# Altium project Audio_Meter_V3.2.PrjPcb (part 3 of 6)

## Sheet Battery Charging_Section.SchDoc
size A; DocumentNumber: 4; SheetNumber: 4; SheetTotal: 8
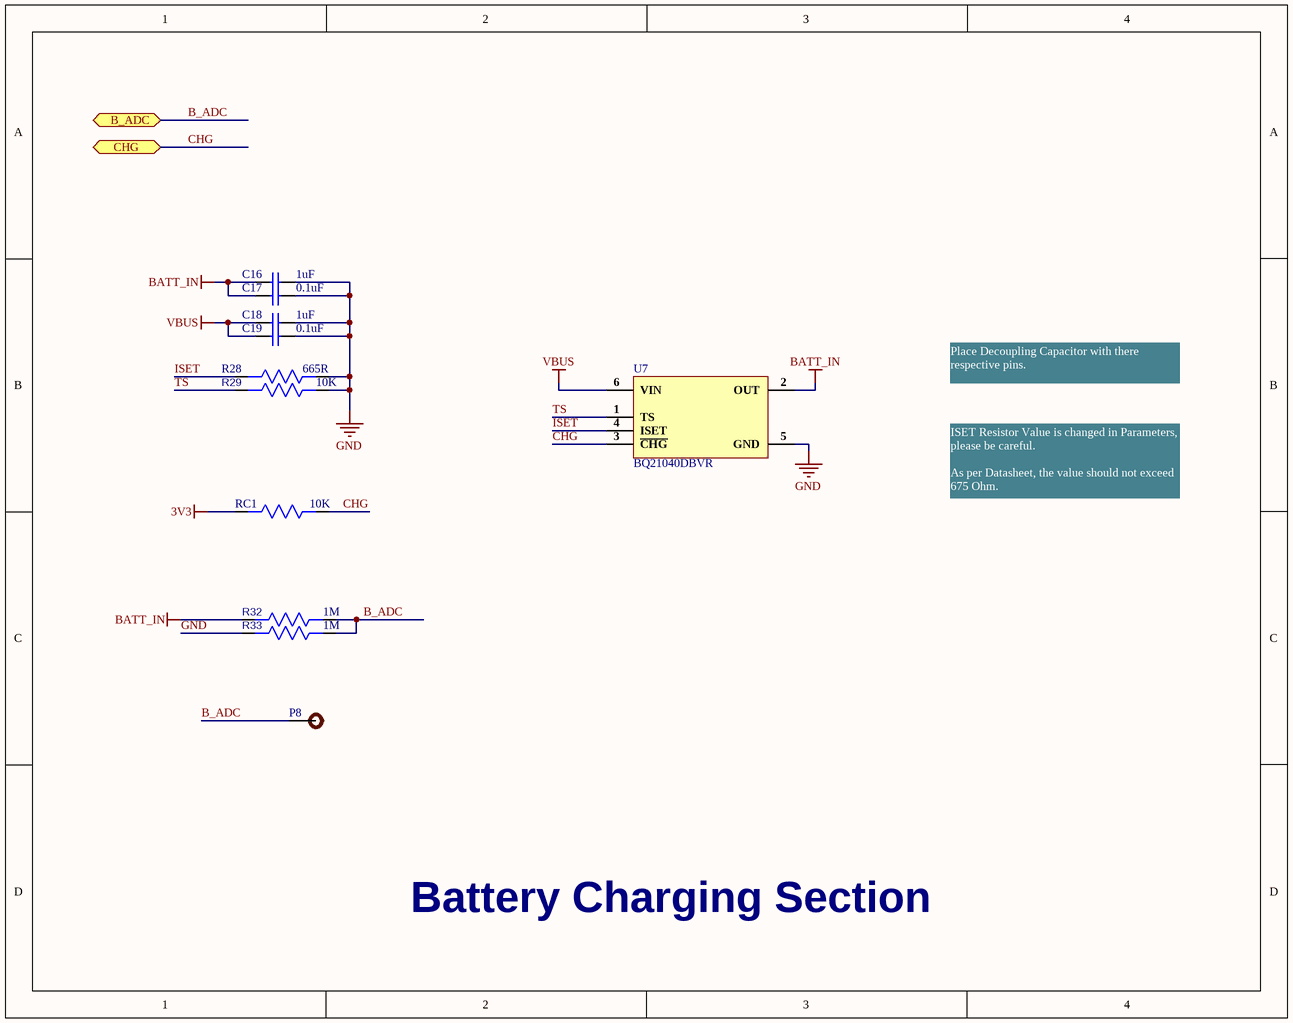
[diagram p4: Battery Charging_Section.SchDoc]

### Parts
C16  1uF  [Cap0805]
C17  0.1uF  [Cap0805]
C18  1uF  [Cap0805]
C19  0.1uF  [Cap0805]
P8  TEST POINT  [TEST POINT]  (value not drawn)
R28  665R  [Res0402]
R29  10K  [RES0805]
R32  1M  [RES0805]
R33  1M  [RES0805]
RC1  10K  [Res0402]
U7  BQ21040DBVR  [SOT-23-6]

### Ports
B_ADC (bidir), CHG (bidir)

### Nets
3V3: RC1.2
BATT_IN: C16.1 C17.1 R32.2 U7.2(OUT)
GND: C16.2 C17.2 C18.2 C19.2 R28.1 R29.1 R33.2 U7.5(GND)
VBUS: C18.1 C19.1 U7.6(VIN)
B_ADC: P8.1 R32.1 R33.1 ; port B_ADC
CHG: RC1.1 U7.3(~{CH}~{G}) ; port CHG
ISET: R28.2 U7.4(ISET)
TS: R29.2 U7.1(TS)

### Notes on the sheet
- Place Decoupling Capacitor with there respective pins.
- ISET Resistor Value is changed in Parameters, please be careful.
  As per Datasheet, the value should not exceed 675 Ohm.
- Battery Charging Section

### Library data of the parts
C16 C18 = CL21B105KOFNNNG: CAP CER 1UF 16V X7R 0805; Manufacturer: Samsung; Material: Ceramic; Tolerance: 10%; Supplier 1: Digi-Key; Manufacturer Part Number: CL21B105KOFNNNG; Stock 1: 507348; Pricing 1: 1=0.1, 10=0.047, 100=0.0211, 500=0.01508, 1000=0.01185 (USD); Mount: Surface Mount; Case/Package: 0805; Case Code (Metric): 2012; Case Code (Imperial): 0805; Min Operating Temperature: -55°C; Max Operating Temperature: 125°C; Package Quantity: 3000; Packaging: Tape and Reel; Capacitance: 1uF; Voltage Rating: 16V; Dielectric: X7R; Voltage: 16V; Length: 2mm; Height: 1.25mm; Width: 0.049inch; Thickness: 0.053inch; Depth: 1.25mm; Lead Free: Lead Free; ComponentLink1URL: http://www.samsungsem.com/global/support/library/product-catalog/__icsFiles/afieldfile/2014/11/13/MLCC.pdf?src-supplier=Digi-Key; ComponentLink1Description: http://www.samsungsem.com/global/support/library/product-catalog/__icsFiles/afieldfile/2014/11/13/MLCC.pdf?src-supplier=Digi-Key; ComponentLink2URL: http://www1.futureelectronics.com/doc/SAMSUNG%20PASSIVE/CL05B104KQ5NNNC.pdf?src-supplier=Future+Electronics; ComponentLink2Description: http://www1.futureelectronics.com/doc/SAMSUNG%20PASSIVE/CL05B104KQ5NNNC.pdf?src-supplier=Future+Electronics; ComponentLink3URL: https://www.distrelec.biz/Web/Downloads/_e/ng/MLCC_CatalogDownload2013_ENG.pdf?mime=application%2Fpdf&src-supplier=Distrelec; ComponentLink3Description: https://www.distrelec.biz/Web/Downloads/_e/ng/MLCC_CatalogDownload2013_ENG.pdf?mime=application%2Fpdf&src-supplier=Distrelec; ComponentLink4URL: https://produktinfo.conrad.com/datenblaetter/450000-474999/455935-da-01-en-VS_KONDENSATOR_0805.pdf?src-supplier=Conrad; ComponentLink4Description: https://produktinfo.conrad.com/datenblaetter/450000-474999/455935-da-01-en-VS_KONDENSATOR_0805.pdf?src-supplier=Conrad; Supplier Part Number 1: 1276-6471-6-ND
C17 C19 = CL21F104ZBCNNNC: CAP CER 0.1UF 50V Y5V 0805; Manufacturer: Samsung; Material: Ceramic; Capacitance: 100nF; Tolerance: 80%; Supplier 1: Digi-Key; Manufacturer Part Number: CL21F104ZBCNNNC; Stock 1: 4901061; Pricing 1: 1=0.1, 10=0.044, 100=0.0195, 500=0.0139, 1000=0.01092 (USD); Mount: Surface Mount; Case/Package: 0805; Case Code (Metric): 2012; Case Code (Imperial): 0805; Min Operating Temperature: -30°C; Max Operating Temperature: 85°C; Dielectric: Y5V; Packaging: Tape and Reel; Voltage Rating: 50V; Package Quantity: 1; Length: 2mm; Height: 0.85mm; Width: 0.049inch; Thickness: 0.037inch; Depth: 1.25mm; Radiation Hardening: No; ComponentLink1URL: https://media.digikey.com/pdf/Data%20Sheets/Samsung%20PDFs/CL_Series_MLCC_ds.pdf?src-supplier=Digi-Key; ComponentLink1Description: https://media.digikey.com/pdf/Data%20Sheets/Samsung%20PDFs/CL_Series_MLCC_ds.pdf?src-supplier=Digi-Key; Supplier Part Number 1: 1276-1007-6-ND
P8 = TEST POINT: Test Point ON
R28 = RC0402FR-07665RL: RES SMD 665 OHM 1% 1/16W 0402; Manufacturer: Yageo; Temperature Coefficient: 100ppm/°C; Power Rating: 62.5mW; Voltage Rating: 50V; Max Power Dissipation: 63mW; Supplier 1: Digi-Key; Manufacturer Part Number: RC0402FR-07665RL; Stock 1: 287830; Pricing 1: 1=0.1, 10=0.015, 100=0.0062, 1000=0.00278, 2500=0.00242, 5000=0.002 (USD); Case/Package: 0402; Contact Plating: Tin,Matte; Case Code (Imperial): 0402; Case Code (Metric): 1005; Min Operating Temperature: -55°C; Max Operating Temperature: 155°C; Resistance: 665R; Tolerance: 1%; Resistor Type: Thick Film; Packaging: Tape and Reel; Number of Terminations: 2; Termination: SMD/SMT; Features: Moisture Resistant; Length: 1mm; Height: 0.016inch; Width: 0.02inch; Depth: 0.5mm; Military Standard: Not; Lead Free: Lead Free; ComponentLink1URL: http://www.yageo.com/documents/recent/PYu-RC0402_51_RoHS_L_6.pdf?src-supplier=Avnet+Europe; ComponentLink1Description: http://www.yageo.com/documents/recent/PYu-RC0402_51_RoHS_L_6.pdf?src-supplier=Avnet+Europe; Supplier Part Number 1: YAG3208CT-ND
R29 = ERJ-P06J103V: RES SMD 10K OHM 5% 1/2W 0805; Manufacturer: Panasonic; Power Rating: 500mW; Voltage Rating: 400V; Temperature Coefficient: 200ppm/°C; Voltage Rating (DC): 150V; ComponentLink1URL: https://www.verical.com/server-webapp/html/getDatasheet?partID=409513; ComponentLink1Description: https://www.verical.com/server-webapp/html/getDatasheet?partID=409513; ComponentLink2URL: http://components.arrow.com/part/dataview/44988207S7163511N1174; ComponentLink2Description: http://components.arrow.com/part/dataview/44988207S7163511N1174; ComponentLink3URL: https://www.seielect.com/Catalog/SEI-RMCF_RMCP.pdf; ComponentLink3Description: https://www.seielect.com/Catalog/SEI-RMCF_RMCP.pdf; ComponentLink4URL: http://www.seielect.com/catalog/sei-rmc.pdf; ComponentLink4Description: http://www.seielect.com/catalog/sei-rmc.pdf; ComponentLink5URL: https://datasheet.ciiva.com/7777/424479-7777391.pdf; ComponentLink5Description: https://datasheet.ciiva.com/7777/424479-7777391.pdf; ComponentLink6URL: https://datasheet.ciiva.com/2581/crcwhpe3-2581488.pdf; ComponentLink6Description: https://datasheet.ciiva.com/2581/crcwhpe3-2581488.pdf; ComponentLink7URL: https://datasheet.ciiva.com/11808/0900766b80d98b26-11808546.pdf; ComponentLink7Description: https://datasheet.ciiva.com/11808/0900766b80d98b26-11808546.pdf; ComponentLink8URL: https://datasheet.ciiva.com/8934/dcrcwe3-8934585.pdf; ComponentLink8Description: https://datasheet.ciiva.com/8934/dcrcwe3-8934585.pdf; ComponentLink9URL: https://datasheet.ciiva.com/2467/dcrcwe3-2467241.pdf; ComponentLink9Description: https://datasheet.ciiva.com/2467/dcrcwe3-2467241.pdf; ComponentLink10URL: https://datasheet.ciiva.com/7777/1697337-7777401.pdf; ComponentLink10Description: https://datasheet.ciiva.com/7777/1697337-7777401.pdf; ComponentLink11URL: https://datasheet.ciiva.com/16852/dcrcwe3-16852347.pdf; ComponentLink11Description: https://datasheet.ciiva.com/16852/dcrcwe3-16852347.pdf; ComponentLink12URL: https://datasheet.ciiva.com/16200/dcrcwe3-16200123.pdf; ComponentLink12Description: https://datasheet.ciiva.com/16200/dcrcwe3-16200123.pdf; ComponentLink13URL: https://datasheet.ciiva.com/16725/70201119-16725227.pdf; ComponentLink13Description: https://datasheet.ciiva.com/16725/70201119-16725227.pdf; ComponentLink14URL: https://datasheet.ciiva.com/2467/dcrcwe3-2467239.pdf; ComponentLink14Description: https://datasheet.ciiva.com/2467/dcrcwe3-2467239.pdf; ComponentLink15URL: https://datasheet.ciiva.com/7777/1720486-7777575.pdf; ComponentLink15Description: https://datasheet.ciiva.com/7777/1720486-7777575.pdf; ComponentLink16URL: https://datasheet.ciiva.com/8934/dcrcwe3-8934581.pdf; ComponentLink16Description: https://datasheet.ciiva.com/8934/dcrcwe3-8934581.pdf; ComponentLink17URL: https://datasheet.ciiva.com/2467/dcrcwe3-2467240.pdf; ComponentLink17Description: https://datasheet.ciiva.com/2467/dcrcwe3-2467240.pdf; ComponentLink18URL: https://datasheet.ciiva.com/7777/1720486-7777576.pdf; ComponentLink18Description: https://datasheet.ciiva.com/7777/1720486-7777576.pdf; ComponentLink19URL: https://datasheet.ciiva.com/5546/dcrcwe3-109170-5546983.pdf; ComponentLink19Description: https://datasheet.ciiva.com/5546/dcrcwe3-109170-5546983.pdf; ComponentLink20URL: https://datasheet.ciiva.com/16755/70201119-16755757.pdf; ComponentLink20Description: https://datasheet.ciiva.com/16755/70201119-16755757.pdf; ComponentLink21URL: https://datasheet.ciiva.com/3258/dcrcwe3-3258221.pdf; ComponentLink21Description: https://datasheet.ciiva.com/3258/dcrcwe3-3258221.pdf; ComponentLink22URL: https://datasheet.ciiva.com/17204/dcrcwe3-17204398.pdf; ComponentLink22Description: https://datasheet.ciiva.com/17204/dcrcwe3-17204398.pdf; ComponentLink23URL: https://datasheet.ciiva.com/16435/dcrcwe3-16435934.pdf; ComponentLink23Description: https://datasheet.ciiva.com/16435/dcrcwe3-16435934.pdf; ComponentLink24URL: https://datasheet.ciiva.com/46441/1533075-46441628.pdf; ComponentLink24Description: https://datasheet.ciiva.com/46441/1533075-46441628.pdf; ComponentLink25URL: https://datasheet.ciiva.com/5544/dcrcwe3-109170-5544649.pdf; ComponentLink25Description: https://datasheet.ciiva.com/5544/dcrcwe3-109170-5544649.pdf; ComponentLink26URL: https://datasheet.ciiva.com/8337/dcrcwe3-8337669.pdf; ComponentLink26Description: https://datasheet.ciiva.com/8337/dcrcwe3-8337669.pdf; ComponentLink27URL: https://datasheet.ciiva.com/2463/dcrcwe3-2463179.pdf; ComponentLink27Description: https://datasheet.ciiva.com/2463/dcrcwe3-2463179.pdf; ComponentLink28URL: https://datasheet.ciiva.com/2463/dcrcwe3-2463178.pdf; ComponentLink28Description: https://datasheet.ciiva.com/2463/dcrcwe3-2463178.pdf; ComponentLink29URL: https://datasheet.ciiva.com/2474/crcwhpe3-2474640.pdf; ComponentLink29Description: https://datasheet.ciiva.com/2474/crcwhpe3-2474640.pdf; ComponentLink30URL: https://datasheet.ciiva.com/48527/crcwhpe3-48527638.pdf; ComponentLink30Description: https://datasheet.ciiva.com/48527/crcwhpe3-48527638.pdf; ComponentLink31URL: https://datasheet.ciiva.com/5547/crcwhpe3-46056-5547896.pdf; ComponentLink31Description: https://datasheet.ciiva.com/5547/crcwhpe3-46056-5547896.pdf; ComponentLink32URL: https://datasheet.ciiva.com/9112/crcwhpe3-9112140.pdf; ComponentLink32Description: https://datasheet.ciiva.com/9112/crcwhpe3-9112140.pdf; ComponentLink33URL: https://datasheet.ciiva.com/2474/crcwhpe3-2474638.pdf; ComponentLink33Description: https://datasheet.ciiva.com/2474/crcwhpe3-2474638.pdf; ComponentLink34URL: https://datasheet.ciiva.com/2474/crcwhpe3-2474639.pdf; ComponentLink34Description: https://datasheet.ciiva.com/2474/crcwhpe3-2474639.pdf; Supplier 1: Digi-Key; Manufacturer Part Number: ERJ-P06J103V; Stock 1: 130484; Pricing 1: 1=0.11, 10=0.103, 100=0.0396, 1000=0.0174, 2500=0.0151 (USD); Mount: Surface Mount; Case/Package: 0805; Weight: 0.000194oz; Case Code (Metric): 2012; Case Code (Imperial): 0805; Contact Plating: Tin; Min Operating Temperature: -55°C; Max Operating Temperature: 155°C; Resistance: 10K; Tolerance: 5%; Packaging: Tape and Reel; Package Quantity: 1; Composition: Thick Film; Number of Terminations: 2; Termination: SMD/SMT; Military Standard: Not; Max Power Dissipation: 500mW; Features: Automotive AEC-Q200; Length: 2mm; Height: 0.6mm; Width: 0.049inch; Depth: 1.25mm; Radiation Hardening: No; REACH SVHC: Unknown; Lead Free: Lead Free; ComponentLink35URL: http://uk.rs-online.com/webdocs/12cb/0900766b812cb812.pdf?src-supplier=RSComponents; ComponentLink35Description: http://uk.rs-online.com/webdocs/12cb/0900766b812cb812.pdf?src-supplier=RSComponents; ComponentLink36URL: http://industrial.panasonic.com/www-data/pdf/AOA0000/AOA0000CE4.pdf?src-supplier=Avnet; ComponentLink36Description: http://industrial.panasonic.com/www-data/pdf/AOA0000/AOA0000CE4.pdf?src-supplier=Avnet; ComponentLink37URL: http://industrial.panasonic.com/www-data/pdf/AOA0000/AOA0000CE4.pdf?src-supplier=Future+Electronics; ComponentLink37Description: http://industrial.panasonic.com/www-data/pdf/AOA0000/AOA0000CE4.pdf?src-supplier=Future+Electronics; ComponentLink38URL: http://www.farnell.com/datasheets/2059624.pdf?src-supplier=Element14; ComponentLink38Description: http://www.farnell.com/datasheets/2059624.pdf?src-supplier=Element14; ComponentLink39URL: https://www.alliedelec.com/m/d/12e4be79354a6c30aae91f11e8182ea0.pdf?src-supplier=Allied+Electronics; ComponentLink39Description: https://www.alliedelec.com/m/d/12e4be79354a6c30aae91f11e8182ea0.pdf?src-supplier=Allied+Electronics; ComponentLink40URL: http://www.farnell.com/datasheets/2059624.pdf?src-supplier=Farnell; ComponentLink40Description: http://www.farnell.com/datasheets/2059624.pdf?src-supplier=Farnell; Supplier Part Number 1: P10KADCT-ND
R32 R33 = ERJ-P06J105V: RES SMD 1M OHM 5% 1/2W 0805; Manufacturer: Panasonic; Power Rating: 500mW; Voltage Rating: 400V; Temperature Coefficient: 200ppm/°C; Voltage Rating (DC): 150V; ComponentLink1URL: https://www.verical.com/server-webapp/html/getDatasheet?partID=409513; ComponentLink1Description: https://www.verical.com/server-webapp/html/getDatasheet?partID=409513; ComponentLink2URL: http://components.arrow.com/part/dataview/44988207S7163511N1174; ComponentLink2Description: http://components.arrow.com/part/dataview/44988207S7163511N1174; ComponentLink3URL: https://www.seielect.com/Catalog/SEI-RMCF_RMCP.pdf; ComponentLink3Description: https://www.seielect.com/Catalog/SEI-RMCF_RMCP.pdf; ComponentLink4URL: http://www.seielect.com/catalog/sei-rmc.pdf; ComponentLink4Description: http://www.seielect.com/catalog/sei-rmc.pdf; ComponentLink5URL: https://datasheet.ciiva.com/7777/424479-7777391.pdf; ComponentLink5Description: https://datasheet.ciiva.com/7777/424479-7777391.pdf; ComponentLink6URL: https://datasheet.ciiva.com/2581/crcwhpe3-2581488.pdf; ComponentLink6Description: https://datasheet.ciiva.com/2581/crcwhpe3-2581488.pdf; ComponentLink7URL: https://datasheet.ciiva.com/11808/0900766b80d98b26-11808546.pdf; ComponentLink7Description: https://datasheet.ciiva.com/11808/0900766b80d98b26-11808546.pdf; ComponentLink8URL: https://datasheet.ciiva.com/8934/dcrcwe3-8934585.pdf; ComponentLink8Description: https://datasheet.ciiva.com/8934/dcrcwe3-8934585.pdf; ComponentLink9URL: https://datasheet.ciiva.com/2467/dcrcwe3-2467241.pdf; ComponentLink9Description: https://datasheet.ciiva.com/2467/dcrcwe3-2467241.pdf; ComponentLink10URL: https://datasheet.ciiva.com/7777/1697337-7777401.pdf; ComponentLink10Description: https://datasheet.ciiva.com/7777/1697337-7777401.pdf; ComponentLink11URL: https://datasheet.ciiva.com/16852/dcrcwe3-16852347.pdf; ComponentLink11Description: https://datasheet.ciiva.com/16852/dcrcwe3-16852347.pdf; ComponentLink12URL: https://datasheet.ciiva.com/16200/dcrcwe3-16200123.pdf; ComponentLink12Description: https://datasheet.ciiva.com/16200/dcrcwe3-16200123.pdf; ComponentLink13URL: https://datasheet.ciiva.com/16725/70201119-16725227.pdf; ComponentLink13Description: https://datasheet.ciiva.com/16725/70201119-16725227.pdf; ComponentLink14URL: https://datasheet.ciiva.com/2467/dcrcwe3-2467239.pdf; ComponentLink14Description: https://datasheet.ciiva.com/2467/dcrcwe3-2467239.pdf; ComponentLink15URL: https://datasheet.ciiva.com/7777/1720486-7777575.pdf; ComponentLink15Description: https://datasheet.ciiva.com/7777/1720486-7777575.pdf; ComponentLink16URL: https://datasheet.ciiva.com/8934/dcrcwe3-8934581.pdf; ComponentLink16Description: https://datasheet.ciiva.com/8934/dcrcwe3-8934581.pdf; ComponentLink17URL: https://datasheet.ciiva.com/2467/dcrcwe3-2467240.pdf; ComponentLink17Description: https://datasheet.ciiva.com/2467/dcrcwe3-2467240.pdf; ComponentLink18URL: https://datasheet.ciiva.com/7777/1720486-7777576.pdf; ComponentLink18Description: https://datasheet.ciiva.com/7777/1720486-7777576.pdf; ComponentLink19URL: https://datasheet.ciiva.com/5546/dcrcwe3-109170-5546983.pdf; ComponentLink19Description: https://datasheet.ciiva.com/5546/dcrcwe3-109170-5546983.pdf; ComponentLink20URL: https://datasheet.ciiva.com/16755/70201119-16755757.pdf; ComponentLink20Description: https://datasheet.ciiva.com/16755/70201119-16755757.pdf; ComponentLink21URL: https://datasheet.ciiva.com/3258/dcrcwe3-3258221.pdf; ComponentLink21Description: https://datasheet.ciiva.com/3258/dcrcwe3-3258221.pdf; ComponentLink22URL: https://datasheet.ciiva.com/17204/dcrcwe3-17204398.pdf; ComponentLink22Description: https://datasheet.ciiva.com/17204/dcrcwe3-17204398.pdf; ComponentLink23URL: https://datasheet.ciiva.com/16435/dcrcwe3-16435934.pdf; ComponentLink23Description: https://datasheet.ciiva.com/16435/dcrcwe3-16435934.pdf; ComponentLink24URL: https://datasheet.ciiva.com/46441/1533075-46441628.pdf; ComponentLink24Description: https://datasheet.ciiva.com/46441/1533075-46441628.pdf; ComponentLink25URL: https://datasheet.ciiva.com/5544/dcrcwe3-109170-5544649.pdf; ComponentLink25Description: https://datasheet.ciiva.com/5544/dcrcwe3-109170-5544649.pdf; ComponentLink26URL: https://datasheet.ciiva.com/8337/dcrcwe3-8337669.pdf; ComponentLink26Description: https://datasheet.ciiva.com/8337/dcrcwe3-8337669.pdf; ComponentLink27URL: https://datasheet.ciiva.com/2463/dcrcwe3-2463179.pdf; ComponentLink27Description: https://datasheet.ciiva.com/2463/dcrcwe3-2463179.pdf; ComponentLink28URL: https://datasheet.ciiva.com/2463/dcrcwe3-2463178.pdf; ComponentLink28Description: https://datasheet.ciiva.com/2463/dcrcwe3-2463178.pdf; ComponentLink29URL: https://datasheet.ciiva.com/2474/crcwhpe3-2474640.pdf; ComponentLink29Description: https://datasheet.ciiva.com/2474/crcwhpe3-2474640.pdf; ComponentLink30URL: https://datasheet.ciiva.com/48527/crcwhpe3-48527638.pdf; ComponentLink30Description: https://datasheet.ciiva.com/48527/crcwhpe3-48527638.pdf; ComponentLink31URL: https://datasheet.ciiva.com/5547/crcwhpe3-46056-5547896.pdf; ComponentLink31Description: https://datasheet.ciiva.com/5547/crcwhpe3-46056-5547896.pdf; ComponentLink32URL: https://datasheet.ciiva.com/9112/crcwhpe3-9112140.pdf; ComponentLink32Description: https://datasheet.ciiva.com/9112/crcwhpe3-9112140.pdf; ComponentLink33URL: https://datasheet.ciiva.com/2474/crcwhpe3-2474638.pdf; ComponentLink33Description: https://datasheet.ciiva.com/2474/crcwhpe3-2474638.pdf; ComponentLink34URL: https://datasheet.ciiva.com/2474/crcwhpe3-2474639.pdf; ComponentLink34Description: https://datasheet.ciiva.com/2474/crcwhpe3-2474639.pdf; ComponentLink35URL: http://uk.rs-online.com/webdocs/12cb/0900766b812cb812.pdf?src-supplier=RSComponents; ComponentLink35Description: http://uk.rs-online.com/webdocs/12cb/0900766b812cb812.pdf?src-supplier=RSComponents; ComponentLink36URL: http://industrial.panasonic.com/www-data/pdf/AOA0000/AOA0000CE4.pdf?src-supplier=Avnet; ComponentLink36Description: http://industrial.panasonic.com/www-data/pdf/AOA0000/AOA0000CE4.pdf?src-supplier=Avnet; ComponentLink37URL: http://industrial.panasonic.com/www-data/pdf/AOA0000/AOA0000CE4.pdf?src-supplier=Future+Electronics; ComponentLink37Description: http://industrial.panasonic.com/www-data/pdf/AOA0000/AOA0000CE4.pdf?src-supplier=Future+Electronics; ComponentLink38URL: http://www.farnell.com/datasheets/2059624.pdf?src-supplier=Element14; ComponentLink38Description: http://www.farnell.com/datasheets/2059624.pdf?src-supplier=Element14; ComponentLink39URL: https://www.alliedelec.com/m/d/12e4be79354a6c30aae91f11e8182ea0.pdf?src-supplier=Allied+Electronics; ComponentLink39Description: https://www.alliedelec.com/m/d/12e4be79354a6c30aae91f11e8182ea0.pdf?src-supplier=Allied+Electronics; ComponentLink40URL: http://www.farnell.com/datasheets/2059624.pdf?src-supplier=Farnell; ComponentLink40Description: http://www.farnell.com/datasheets/2059624.pdf?src-supplier=Farnell; ComponentLink41URL: http://www.alliedelec.com/m/d/12e4be79354a6c30aae91f11e8182ea0.pdf?src-supplier=Allied+Electronics; ComponentLink41Description: http://www.alliedelec.com/m/d/12e4be79354a6c30aae91f11e8182ea0.pdf?src-supplier=Allied+Electronics; ComponentLink42URL: http://www.mouser.com/ds/2/315/AOA0000CE4-64075.pdf?src-supplier=Mouser; ComponentLink42Description: http://www.mouser.com/ds/2/315/AOA0000CE4-64075.pdf?src-supplier=Mouser; ComponentLink43URL: http://industrial.panasonic.com/www-data/pdf/AOA0000/AOA0000CE4.pdf?src-supplier=Avnet+Europe; ComponentLink43Description: http://industrial.panasonic.com/www-data/pdf/AOA0000/AOA0000CE4.pdf?src-supplier=Avnet+Europe; Supplier 1: Digi-Key; Manufacturer Part Number: ERJ-P06J105V; Stock 1: 57880; Pricing 1: 1=0.11, 10=0.103, 100=0.0396, 1000=0.0174, 2500=0.0151 (USD); Mount: Surface Mount; Case/Package: 0805; Case Code (Metric): 2012; Case Code (Imperial): 0805; Contact Plating: Tin; Min Operating Temperature: -55°C; Max Operating Temperature: 155°C; Resistance: 1M; Tolerance: 5%; Packaging: Tape and Reel; Package Quantity: 1; Composition: Thick Film; Number of Terminations: 2; Military Standard: Not; Termination: SMD/SMT; Max Power Dissipation: 500mW; Features: Automotive AEC-Q200; Length: 2mm; Height: 0.6mm; Width: 0.049inch; Depth: 1.25mm; Radiation Hardening: No; REACH SVHC: Unknown; Lead Free: Lead Free; Supplier Part Number 1: P1.0MADCT-ND
RC1 = RC0402JR-0710KL: RES SMD 10K OHM 5% 1/16W 0402; Manufacturer: Yageo; Resistance: 10kR; Temperature Coefficient: 100ppm/°C; Power Rating: 62.5mW; Voltage Rating: 50V; Max Power Dissipation: 63mW; ComponentLink1URL: https://www.verical.com/server-webapp/html/getDatasheet?partID=89073&src-supplier=Verical; ComponentLink1Description: https://www.verical.com/server-webapp/html/getDatasheet?partID=89073&src-supplier=Verical; ComponentLink2URL: http://www.yageo.com/documents/recent/PYu-RC_Group_51_RoHS_L_10.pdf?src-supplier=Digi-Key; ComponentLink2Description: http://www.yageo.com/documents/recent/PYu-RC_Group_51_RoHS_L_10.pdf?src-supplier=Digi-Key; ComponentLink3URL: http://www.mouser.com/ds/2/447/PYu-RC0402_51_RoHS_L_6_r-8721.pdf?src-supplier=Mouser; ComponentLink3Description: http://www.mouser.com/ds/2/447/PYu-RC0402_51_RoHS_L_6_r-8721.pdf?src-supplier=Mouser; ComponentLink4URL: http://www.farnell.com/datasheets/2167052.pdf?src-supplier=Element14; ComponentLink4Description: http://www.farnell.com/datasheets/2167052.pdf?src-supplier=Element14; Supplier 1: Digi-Key; Manufacturer Part Number: RC0402JR-0710KL; Stock 1: 6219642; Pricing 1: 1=0.1, 10=0.013, 100=0.0053, 1000=0.0024, 2500=0.0021, 5000=0.0017 (USD); Case/Package: 0402; Case Code (Metric): 1005; Case Code (Imperial): 0402; Min Operating Temperature: -55°C; Max Operating Temperature: 155°C; Tolerance: 5%; Packaging: Tape and Reel; Package Quantity: 1; Composition: Thick Film; Number of Terminations: 2; Termination: SMD/SMT; Military Standard: Not; Features: Moisture Resistant; Length: 1mm; Height: 0.016inch; Width: 0.02inch; Depth: 0.5mm; REACH SVHC: Unknown; Lead Free: Lead Free; Supplier Part Number 1: 311-10KJRCT-ND
U7 = BQ21040DBVR: IC BAT CHG LI-ION 1 CELL SOT23-6; Manufacturer: Texas Instruments; Number of Cells: 1; Fault Protection: Over Voltage,Over Temperature,Short Circuit; Interface: USB,SPI; Output Type: Analog Current/Voltage; Max Charge Current: 800mA; Battery Pack Voltage: 4.2V; Max Supply Voltage: 6.45V; Number of Bits: 16; Number of D/A Converters: 4; Settling Time: 30us; Differential Output: No; Supplier 1: Digi-Key; Manufacturer Part Number: BQ21040DBVR; Stock 1: 5958; Pricing 1: 1=1.14, 10=1.015, 100=0.7396, 500=0.61924, 1000=0.48163 (USD); Mount: Surface Mount; Case/Package: SOT-23-6; Min Operating Temperature: 0°C; Max Operating Temperature: 125°C; Packaging: Cut Tape; Lead Free: Lead Free; ComponentLink1URL: http://www.ti.com/lit/ds/symlink/bq21040.pdf?src-supplier=Digi-Key; ComponentLink1Description: http://www.ti.com/lit/ds/symlink/bq21040.pdf?src-supplier=Digi-Key; ComponentLink2URL: http://www.ti.com/general/docs/suppproductinfo.tsp?distId=10&gotoUrl=http%3A%2F%2Fwww.ti.com%2Flit%2Fgpn%2Fbq21040&src-supplier=Digi-Key; ComponentLink2Description: http://www.ti.com/general/docs/suppproductinfo.tsp?distId=10&gotoUrl=http%3A%2F%2Fwww.ti.com%2Flit%2Fgpn%2Fbq21040&src-supplier=Digi-Key; ComponentLink3URL: http://www.ti.com/general/docs/suppproductinfo.tsp?distId=10&amp;gotoUrl=http%3A%2F%2Fwww.ti.com%2Flit%2Fgpn%2Fbq21040&src-supplier=Digi-Key; ComponentLink3Description: http://www.ti.com/general/docs/suppproductinfo.tsp?distId=10&amp;gotoUrl=http%3A%2F%2Fwww.ti.com%2Flit%2Fgpn%2Fbq21040&src-supplier=Digi-Key; Supplier Part Number 1: 296-47315-1-ND

## Sheet Power_Section.SchDoc
size A4; DocumentNumber: 2; SheetNumber: 2; SheetTotal: 8
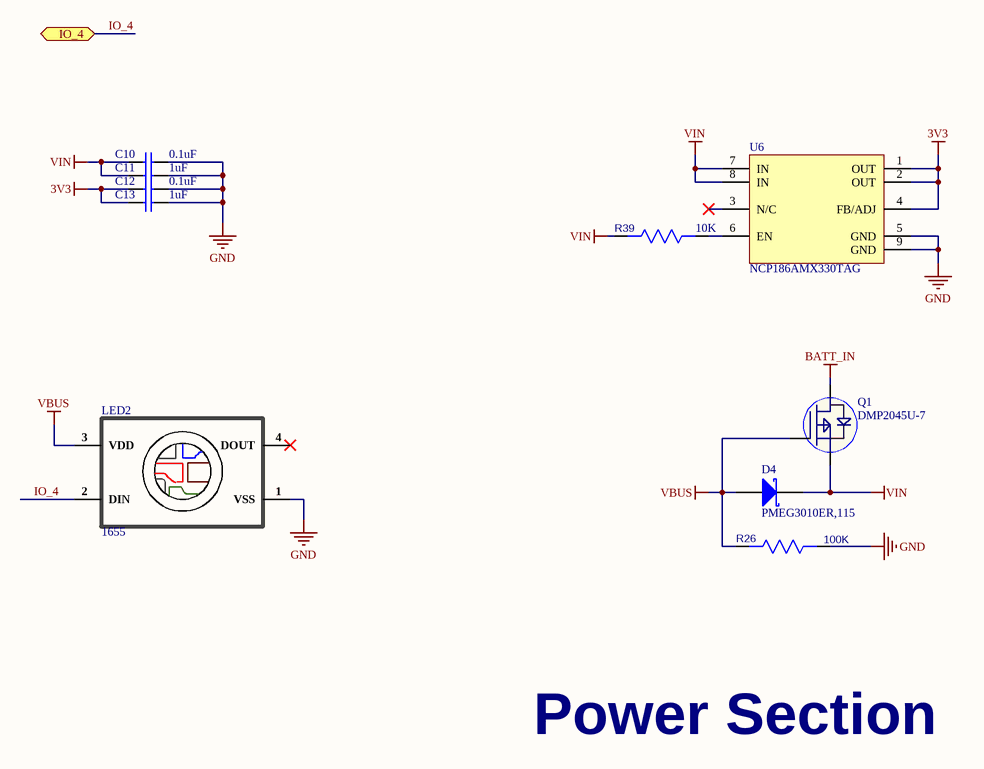
[diagram p5: Power_Section.SchDoc]

### Parts
C10  0.1uF  [Cap0805]
C11  1uF  [Cap0805]
C12  0.1uF  [Cap0805]
C13  1uF  [Cap0805]
D4  PMEG3010ER,115  [PMEG3010ER,115]
LED2  1655  [1655]
Q1  DMP2045U-7  [SOT-23]
R26  100K  [RES0805]
R39  10K  [RES0805]
U6  NCP186AMX330TAG  [NCP186AMX330TAG]

### Ports
IO_4 (bidir)

### Nets
3V3: C12.1 C13.1 U6.1(OUT) U6.2(OUT) U6.4(FB/ADJ)
BATT_IN: Q1.3(D)
GND: C10.2 C11.2 C12.2 C13.2 LED2.1(VSS) R26.1 U6.5(GND) U6.9(GND)
VBUS: D4.A LED2.3(VDD) Q1.1(G) R26.2
VIN: C10.1 C11.1 D4.K Q1.2(S) R39.2 U6.7(IN) U6.8(IN)
IO_4: LED2.2(DIN) ; port IO_4
NetR39_1: R39.1 U6.6(EN)

Not connected (* = marked no-connect by the designer): LED2 4(DOUT)*; U6 3(N/C)*

### Notes on the sheet
- Power Section

### Library data of the parts
C10 C12 = CL21F104ZBCNNNC: as C17 on sheet Battery Charging_Section; Supplier 1: Digi-Key; Manufacturer Part Number: CL21F104ZBCNNNC; Stock 1: 4901061; Pricing 1: 1=0.1, 10=0.044, 100=0.0195, 500=0.0139, 1000=0.01092 (USD); Mount: Surface Mount; Case/Package: 0805; Case Code (Metric): 2012; Case Code (Imperial): 0805; Min Operating Temperature: -30°C; Max Operating Temperature: 85°C; Dielectric: Y5V; Packaging: Tape and Reel; Voltage Rating: 50V; Package Quantity: 1; Length: 2mm; Height: 0.85mm; Width: 0.049inch; Thickness: 0.037inch; Depth: 1.25mm; Radiation Hardening: No; ComponentLink1URL: https://media.digikey.com/pdf/Data%20Sheets/Samsung%20PDFs/CL_Series_MLCC_ds.pdf?src-supplier=Digi-Key; ComponentLink1Description: https://media.digikey.com/pdf/Data%20Sheets/Samsung%20PDFs/CL_Series_MLCC_ds.pdf?src-supplier=Digi-Key; Supplier Part Number 1: 1276-1007-6-ND
C11 C13 = CL21B105KOFNNNG: as C16 on sheet Battery Charging_Section; Supplier 1: Digi-Key; Manufacturer Part Number: CL21B105KOFNNNG; Stock 1: 507348; Pricing 1: 1=0.1, 10=0.047, 100=0.0211, 500=0.01508, 1000=0.01185 (USD); Mount: Surface Mount; Case/Package: 0805; Case Code (Metric): 2012; Case Code (Imperial): 0805; Min Operating Temperature: -55°C; Max Operating Temperature: 125°C; Package Quantity: 3000; Packaging: Tape and Reel; Capacitance: 1uF; Voltage Rating: 16V; Dielectric: X7R; Voltage: 16V; Length: 2mm; Height: 1.25mm; Width: 0.049inch; Thickness: 0.053inch; Depth: 1.25mm; Lead Free: Lead Free; ComponentLink1URL: http://www.samsungsem.com/global/support/library/product-catalog/__icsFiles/afieldfile/2014/11/13/MLCC.pdf?src-supplier=Digi-Key; ComponentLink1Description: http://www.samsungsem.com/global/support/library/product-catalog/__icsFiles/afieldfile/2014/11/13/MLCC.pdf?src-supplier=Digi-Key; ComponentLink2URL: http://www1.futureelectronics.com/doc/SAMSUNG%20PASSIVE/CL05B104KQ5NNNC.pdf?src-supplier=Future+Electronics; ComponentLink2Description: http://www1.futureelectronics.com/doc/SAMSUNG%20PASSIVE/CL05B104KQ5NNNC.pdf?src-supplier=Future+Electronics; ComponentLink3URL: https://www.distrelec.biz/Web/Downloads/_e/ng/MLCC_CatalogDownload2013_ENG.pdf?mime=application%2Fpdf&src-supplier=Distrelec; ComponentLink3Description: https://www.distrelec.biz/Web/Downloads/_e/ng/MLCC_CatalogDownload2013_ENG.pdf?mime=application%2Fpdf&src-supplier=Distrelec; ComponentLink4URL: https://produktinfo.conrad.com/datenblaetter/450000-474999/455935-da-01-en-VS_KONDENSATOR_0805.pdf?src-supplier=Conrad; ComponentLink4Description: https://produktinfo.conrad.com/datenblaetter/450000-474999/455935-da-01-en-VS_KONDENSATOR_0805.pdf?src-supplier=Conrad; Supplier Part Number 1: 1276-6471-6-ND
D4 = PMEG3010ER,115: DIODE SCHOTTKY 30V 1A SOD123W; Manufacturer: NXP Semiconductors; Peak Reverse Current: 1.5mA; Peak Non-Repetitive Surge Current: 50A; Element Configuration: Single; Max Power Dissipation: 570mW; Forward Voltage: 360mV; Supplier 1: Digi-Key; Manufacturer Part Number: PMEG3010ER,115; Stock 1: 2796; Pricing 1: 1=0.38, 10=0.305, 100=0.2076, 500=0.1557, 1000=0.1168 (USD); Mount: Surface Mount; Number of Pins: 2; Min Operating Temperature: -55°C; Max Operating Temperature: 150°C; Forward Current: 1A; Max Repetitive Reverse Voltage (Vrrm): 30V; Packaging: Tape and Reel; Max Surge Current: 50A; Package Quantity: 1; Average Rectified Current: 1A; Max Reverse Leakage Current: 1.5mA; Max Reverse Voltage (DC): 30V; Radiation Hardening: No; Lead Free: Lead Free; ComponentLink1URL: https://datasheet.ciiva.com/4715/pmeg3010er-117881-4715350.pdf; ComponentLink1Description: https://datasheet.ciiva.com/4715/pmeg3010er-117881-4715350.pdf; ComponentLink2URL: https://datasheet.ciiva.com/8299/pmeg3010er-8299296.pdf; ComponentLink2Description: https://datasheet.ciiva.com/8299/pmeg3010er-8299296.pdf; ComponentLink3URL: https://datasheet.ciiva.com/913/pmeg3010er-913784.pdf; ComponentLink3Description: https://datasheet.ciiva.com/913/pmeg3010er-913784.pdf; ComponentLink4URL: https://datasheet.ciiva.com/8294/pmeg3010er-8294409.pdf; ComponentLink4Description: https://datasheet.ciiva.com/8294/pmeg3010er-8294409.pdf; ComponentLink5URL: https://datasheet.ciiva.com/913/pmeg3010er-913782.pdf; ComponentLink5Description: https://datasheet.ciiva.com/913/pmeg3010er-913782.pdf; ComponentLink6URL: https://datasheet.ciiva.com/913/pmeg3010er-913783.pdf; ComponentLink6Description: https://datasheet.ciiva.com/913/pmeg3010er-913783.pdf; Supplier Part Number 1: 1727-5201-6-ND
LED2 = 1655: ADDRESS LED DISC SERIAL RGB 1=10; Manufacturer: Adafruit Industries; Color: Blue,Green,Red; Number of LEDs: 10; Supplier 1: Digi-Key; Manufacturer Part Number: 1655; Stock 1: 2943; Pricing 1: 1=4.5 (USD); Mount: Surface Mount; Length: 5mm; Width: 5mm; ComponentLink1URL: https://cdn-shop.adafruit.com/product-files/1138/SK6812+LED+datasheet+.pdf?src-supplier=Digi-Key; ComponentLink1Description: https://cdn-shop.adafruit.com/product-files/1138/SK6812+LED+datasheet+.pdf?src-supplier=Digi-Key; ComponentLink2URL: http://www.mouser.com/ds/2/737/SK6812_LED_datasheet_-953546.pdf?src-supplier=Mouser; ComponentLink2Description: http://www.mouser.com/ds/2/737/SK6812_LED_datasheet_-953546.pdf?src-supplier=Mouser; Supplier Part Number 1: 1528-1104-ND
Q1 = DMP2045U-7: MOSFET P-CHAN 24V SOT23; Manufacturer: Diodes; Drain to Source Voltage (Vdss): 20V; Continuous Drain Current (ID): 4.3A; Rds On Max: 45mR; Input Capacitance: 634pF; Max Power Dissipation: 800mW; Supplier 1: Digi-Key; Manufacturer Part Number: DMP2045U-7; Stock 1: 22481; Pricing 1: 1=0.45, 10=0.333, 100=0.1581, 500=0.12896, 1000=0.09568 (USD); Mount: Surface Mount; Case/Package: SOT-23; Min Operating Temperature: -55°C; Max Operating Temperature: 150°C; Packaging: Tape and Reel; ComponentLink1URL: https://www.diodes.com/assets/Datasheets/DMP2045U.pdf?src-supplier=Digi-Key; ComponentLink1Description: https://www.diodes.com/assets/Datasheets/DMP2045U.pdf?src-supplier=Digi-Key; Supplier Part Number 1: DMP2045U-7DICT-ND
R26 = ERJ-P06J104V: RES SMD 100K OHM 5% 1/2W 0805; Manufacturer: Panasonic; Power Rating: 500mW; Voltage Rating: 400V; Resistance: 100kR; Temperature Coefficient: 200ppm/°C; Max Power Dissipation: 250mW; Voltage Rating (DC): 150V; ComponentLink1URL: https://www.verical.com/server-webapp/html/getDatasheet?partID=409513; ComponentLink1Description: https://www.verical.com/server-webapp/html/getDatasheet?partID=409513; ComponentLink2URL: http://components.arrow.com/part/dataview/44988207S7163511N1174; ComponentLink2Description: http://components.arrow.com/part/dataview/44988207S7163511N1174; ComponentLink3URL: https://www.seielect.com/Catalog/SEI-RMCF_RMCP.pdf; ComponentLink3Description: https://www.seielect.com/Catalog/SEI-RMCF_RMCP.pdf; ComponentLink4URL: http://www.seielect.com/catalog/sei-rmc.pdf; ComponentLink4Description: http://www.seielect.com/catalog/sei-rmc.pdf; ComponentLink5URL: https://datasheet.ciiva.com/7777/424479-7777391.pdf; ComponentLink5Description: https://datasheet.ciiva.com/7777/424479-7777391.pdf; ComponentLink6URL: https://datasheet.ciiva.com/2581/crcwhpe3-2581488.pdf; ComponentLink6Description: https://datasheet.ciiva.com/2581/crcwhpe3-2581488.pdf; ComponentLink7URL: https://datasheet.ciiva.com/11808/0900766b80d98b26-11808546.pdf; ComponentLink7Description: https://datasheet.ciiva.com/11808/0900766b80d98b26-11808546.pdf; ComponentLink8URL: https://datasheet.ciiva.com/8934/dcrcwe3-8934585.pdf; ComponentLink8Description: https://datasheet.ciiva.com/8934/dcrcwe3-8934585.pdf; ComponentLink9URL: https://datasheet.ciiva.com/2467/dcrcwe3-2467241.pdf; ComponentLink9Description: https://datasheet.ciiva.com/2467/dcrcwe3-2467241.pdf; ComponentLink10URL: https://datasheet.ciiva.com/7777/1697337-7777401.pdf; ComponentLink10Description: https://datasheet.ciiva.com/7777/1697337-7777401.pdf; ComponentLink11URL: https://datasheet.ciiva.com/16852/dcrcwe3-16852347.pdf; ComponentLink11Description: https://datasheet.ciiva.com/16852/dcrcwe3-16852347.pdf; ComponentLink12URL: https://datasheet.ciiva.com/16200/dcrcwe3-16200123.pdf; ComponentLink12Description: https://datasheet.ciiva.com/16200/dcrcwe3-16200123.pdf; ComponentLink13URL: https://datasheet.ciiva.com/16725/70201119-16725227.pdf; ComponentLink13Description: https://datasheet.ciiva.com/16725/70201119-16725227.pdf; ComponentLink14URL: https://datasheet.ciiva.com/2467/dcrcwe3-2467239.pdf; ComponentLink14Description: https://datasheet.ciiva.com/2467/dcrcwe3-2467239.pdf; ComponentLink15URL: https://datasheet.ciiva.com/7777/1720486-7777575.pdf; ComponentLink15Description: https://datasheet.ciiva.com/7777/1720486-7777575.pdf; ComponentLink16URL: https://datasheet.ciiva.com/8934/dcrcwe3-8934581.pdf; ComponentLink16Description: https://datasheet.ciiva.com/8934/dcrcwe3-8934581.pdf; ComponentLink17URL: https://datasheet.ciiva.com/2467/dcrcwe3-2467240.pdf; ComponentLink17Description: https://datasheet.ciiva.com/2467/dcrcwe3-2467240.pdf; ComponentLink18URL: https://datasheet.ciiva.com/7777/1720486-7777576.pdf; ComponentLink18Description: https://datasheet.ciiva.com/7777/1720486-7777576.pdf; ComponentLink19URL: https://datasheet.ciiva.com/5546/dcrcwe3-109170-5546983.pdf; ComponentLink19Description: https://datasheet.ciiva.com/5546/dcrcwe3-109170-5546983.pdf; ComponentLink20URL: https://datasheet.ciiva.com/16755/70201119-16755757.pdf; ComponentLink20Description: https://datasheet.ciiva.com/16755/70201119-16755757.pdf; ComponentLink21URL: https://datasheet.ciiva.com/3258/dcrcwe3-3258221.pdf; ComponentLink21Description: https://datasheet.ciiva.com/3258/dcrcwe3-3258221.pdf; ComponentLink22URL: https://datasheet.ciiva.com/17204/dcrcwe3-17204398.pdf; ComponentLink22Description: https://datasheet.ciiva.com/17204/dcrcwe3-17204398.pdf; ComponentLink23URL: https://datasheet.ciiva.com/16435/dcrcwe3-16435934.pdf; ComponentLink23Description: https://datasheet.ciiva.com/16435/dcrcwe3-16435934.pdf; ComponentLink24URL: https://datasheet.ciiva.com/46441/1533075-46441628.pdf; ComponentLink24Description: https://datasheet.ciiva.com/46441/1533075-46441628.pdf; ComponentLink25URL: https://datasheet.ciiva.com/5544/dcrcwe3-109170-5544649.pdf; ComponentLink25Description: https://datasheet.ciiva.com/5544/dcrcwe3-109170-5544649.pdf; ComponentLink26URL: https://datasheet.ciiva.com/8337/dcrcwe3-8337669.pdf; ComponentLink26Description: https://datasheet.ciiva.com/8337/dcrcwe3-8337669.pdf; ComponentLink27URL: https://datasheet.ciiva.com/2463/dcrcwe3-2463179.pdf; ComponentLink27Description: https://datasheet.ciiva.com/2463/dcrcwe3-2463179.pdf; ComponentLink28URL: https://datasheet.ciiva.com/2463/dcrcwe3-2463178.pdf; ComponentLink28Description: https://datasheet.ciiva.com/2463/dcrcwe3-2463178.pdf; ComponentLink29URL: https://datasheet.ciiva.com/2474/crcwhpe3-2474640.pdf; ComponentLink29Description: https://datasheet.ciiva.com/2474/crcwhpe3-2474640.pdf; ComponentLink30URL: https://datasheet.ciiva.com/48527/crcwhpe3-48527638.pdf; ComponentLink30Description: https://datasheet.ciiva.com/48527/crcwhpe3-48527638.pdf; ComponentLink31URL: https://datasheet.ciiva.com/5547/crcwhpe3-46056-5547896.pdf; ComponentLink31Description: https://datasheet.ciiva.com/5547/crcwhpe3-46056-5547896.pdf; ComponentLink32URL: https://datasheet.ciiva.com/9112/crcwhpe3-9112140.pdf; ComponentLink32Description: https://datasheet.ciiva.com/9112/crcwhpe3-9112140.pdf; ComponentLink33URL: https://datasheet.ciiva.com/2474/crcwhpe3-2474638.pdf; ComponentLink33Description: https://datasheet.ciiva.com/2474/crcwhpe3-2474638.pdf; ComponentLink34URL: https://datasheet.ciiva.com/2474/crcwhpe3-2474639.pdf; ComponentLink34Description: https://datasheet.ciiva.com/2474/crcwhpe3-2474639.pdf; ComponentLink35URL: http://uk.rs-online.com/webdocs/12cb/0900766b812cb812.pdf?src-supplier=RSComponents; ComponentLink35Description: http://uk.rs-online.com/webdocs/12cb/0900766b812cb812.pdf?src-supplier=RSComponents; ComponentLink36URL: http://industrial.panasonic.com/www-data/pdf/AOA0000/AOA0000CE4.pdf?src-supplier=Avnet; ComponentLink36Description: http://industrial.panasonic.com/www-data/pdf/AOA0000/AOA0000CE4.pdf?src-supplier=Avnet; ComponentLink37URL: http://industrial.panasonic.com/www-data/pdf/AOA0000/AOA0000CE4.pdf?src-supplier=Future+Electronics; ComponentLink37Description: http://industrial.panasonic.com/www-data/pdf/AOA0000/AOA0000CE4.pdf?src-supplier=Future+Electronics; ComponentLink38URL: http://www.farnell.com/datasheets/2059624.pdf?src-supplier=Element14; ComponentLink38Description: http://www.farnell.com/datasheets/2059624.pdf?src-supplier=Element14; ComponentLink39URL: https://www.alliedelec.com/m/d/12e4be79354a6c30aae91f11e8182ea0.pdf?src-supplier=Allied+Electronics; ComponentLink39Description: https://www.alliedelec.com/m/d/12e4be79354a6c30aae91f11e8182ea0.pdf?src-supplier=Allied+Electronics; ComponentLink40URL: http://www.farnell.com/datasheets/2059624.pdf?src-supplier=Farnell; ComponentLink40Description: http://www.farnell.com/datasheets/2059624.pdf?src-supplier=Farnell; Supplier 1: Digi-Key; Manufacturer Part Number: ERJ-P06J104V; Stock 1: 131043; Pricing 1: 1=0.11, 10=0.103, 100=0.0396, 1000=0.0174, 2500=0.0151 (USD); Mount: Surface Mount; Case/Package: 0805; Case Code (Imperial): 0805; Case Code (Metric): 2012; Contact Plating: Tin; Min Operating Temperature: -55°C; Max Operating Temperature: 155°C; Tolerance: 5%; Packaging: Tape and Reel; Package Quantity: 5000; Composition: Thick Film; Number of Terminations: 2; Termination: SMD/SMT; Military Standard: Not; Length: 2mm; Height: 0.6mm; Width: 1.2mm; Depth: 1.25mm; Radiation Hardening: No; REACH SVHC: No SVHC; Lead Free: Lead Free; ComponentLink41URL: http://industrial.panasonic.com/cdbs/www-data/pdf/RDO0000/AOA0000C331.pdf?src-supplier=Newark; ComponentLink41Description: http://industrial.panasonic.com/cdbs/www-data/pdf/RDO0000/AOA0000C331.pdf?src-supplier=Newark; ComponentLink42URL: https://industrial.panasonic.com/ww/system/files/data/download/catalog/id_fixed-resistors_e_1.pdf?src-supplier=Allied+Electronics; ComponentLink42Description: https://industrial.panasonic.com/ww/system/files/data/download/catalog/id_fixed-resistors_e_1.pdf?src-supplier=Allied+Electronics; ComponentLink43URL: http://industrial.panasonic.com/www-data/pdf/AOA0000/AOA0000CE4.pdf?src-supplier=Avnet+Europe; ComponentLink43Description: http://industrial.panasonic.com/www-data/pdf/AOA0000/AOA0000CE4.pdf?src-supplier=Avnet+Europe; Supplier Part Number 1: P100KADCT-ND
R39 = ERJ-P06J103V: as R29 on sheet Battery Charging_Section; ComponentLink1URL: https://www.verical.com/server-webapp/html/getDatasheet?partID=409513; ComponentLink1Description: https://www.verical.com/server-webapp/html/getDatasheet?partID=409513; ComponentLink2URL: http://components.arrow.com/part/dataview/44988207S7163511N1174; ComponentLink2Description: http://components.arrow.com/part/dataview/44988207S7163511N1174; ComponentLink3URL: https://www.seielect.com/Catalog/SEI-RMCF_RMCP.pdf; ComponentLink3Description: https://www.seielect.com/Catalog/SEI-RMCF_RMCP.pdf; ComponentLink4URL: http://www.seielect.com/catalog/sei-rmc.pdf; ComponentLink4Description: http://www.seielect.com/catalog/sei-rmc.pdf; ComponentLink5URL: https://datasheet.ciiva.com/7777/424479-7777391.pdf; ComponentLink5Description: https://datasheet.ciiva.com/7777/424479-7777391.pdf; ComponentLink6URL: https://datasheet.ciiva.com/2581/crcwhpe3-2581488.pdf; ComponentLink6Description: https://datasheet.ciiva.com/2581/crcwhpe3-2581488.pdf; ComponentLink7URL: https://datasheet.ciiva.com/11808/0900766b80d98b26-11808546.pdf; ComponentLink7Description: https://datasheet.ciiva.com/11808/0900766b80d98b26-11808546.pdf; ComponentLink8URL: https://datasheet.ciiva.com/8934/dcrcwe3-8934585.pdf; ComponentLink8Description: https://datasheet.ciiva.com/8934/dcrcwe3-8934585.pdf; ComponentLink9URL: https://datasheet.ciiva.com/2467/dcrcwe3-2467241.pdf; ComponentLink9Description: https://datasheet.ciiva.com/2467/dcrcwe3-2467241.pdf; ComponentLink10URL: https://datasheet.ciiva.com/7777/1697337-7777401.pdf; ComponentLink10Description: https://datasheet.ciiva.com/7777/1697337-7777401.pdf; ComponentLink11URL: https://datasheet.ciiva.com/16852/dcrcwe3-16852347.pdf; ComponentLink11Description: https://datasheet.ciiva.com/16852/dcrcwe3-16852347.pdf; ComponentLink12URL: https://datasheet.ciiva.com/16200/dcrcwe3-16200123.pdf; ComponentLink12Description: https://datasheet.ciiva.com/16200/dcrcwe3-16200123.pdf; ComponentLink13URL: https://datasheet.ciiva.com/16725/70201119-16725227.pdf; ComponentLink13Description: https://datasheet.ciiva.com/16725/70201119-16725227.pdf; ComponentLink14URL: https://datasheet.ciiva.com/2467/dcrcwe3-2467239.pdf; ComponentLink14Description: https://datasheet.ciiva.com/2467/dcrcwe3-2467239.pdf; ComponentLink15URL: https://datasheet.ciiva.com/7777/1720486-7777575.pdf; ComponentLink15Description: https://datasheet.ciiva.com/7777/1720486-7777575.pdf; ComponentLink16URL: https://datasheet.ciiva.com/8934/dcrcwe3-8934581.pdf; ComponentLink16Description: https://datasheet.ciiva.com/8934/dcrcwe3-8934581.pdf; ComponentLink17URL: https://datasheet.ciiva.com/2467/dcrcwe3-2467240.pdf; ComponentLink17Description: https://datasheet.ciiva.com/2467/dcrcwe3-2467240.pdf; ComponentLink18URL: https://datasheet.ciiva.com/7777/1720486-7777576.pdf; ComponentLink18Description: https://datasheet.ciiva.com/7777/1720486-7777576.pdf; ComponentLink19URL: https://datasheet.ciiva.com/5546/dcrcwe3-109170-5546983.pdf; ComponentLink19Description: https://datasheet.ciiva.com/5546/dcrcwe3-109170-5546983.pdf; ComponentLink20URL: https://datasheet.ciiva.com/16755/70201119-16755757.pdf; ComponentLink20Description: https://datasheet.ciiva.com/16755/70201119-16755757.pdf; ComponentLink21URL: https://datasheet.ciiva.com/3258/dcrcwe3-3258221.pdf; ComponentLink21Description: https://datasheet.ciiva.com/3258/dcrcwe3-3258221.pdf; ComponentLink22URL: https://datasheet.ciiva.com/17204/dcrcwe3-17204398.pdf; ComponentLink22Description: https://datasheet.ciiva.com/17204/dcrcwe3-17204398.pdf; ComponentLink23URL: https://datasheet.ciiva.com/16435/dcrcwe3-16435934.pdf; ComponentLink23Description: https://datasheet.ciiva.com/16435/dcrcwe3-16435934.pdf; ComponentLink24URL: https://datasheet.ciiva.com/46441/1533075-46441628.pdf; ComponentLink24Description: https://datasheet.ciiva.com/46441/1533075-46441628.pdf; ComponentLink25URL: https://datasheet.ciiva.com/5544/dcrcwe3-109170-5544649.pdf; ComponentLink25Description: https://datasheet.ciiva.com/5544/dcrcwe3-109170-5544649.pdf; ComponentLink26URL: https://datasheet.ciiva.com/8337/dcrcwe3-8337669.pdf; ComponentLink26Description: https://datasheet.ciiva.com/8337/dcrcwe3-8337669.pdf; ComponentLink27URL: https://datasheet.ciiva.com/2463/dcrcwe3-2463179.pdf; ComponentLink27Description: https://datasheet.ciiva.com/2463/dcrcwe3-2463179.pdf; ComponentLink28URL: https://datasheet.ciiva.com/2463/dcrcwe3-2463178.pdf; ComponentLink28Description: https://datasheet.ciiva.com/2463/dcrcwe3-2463178.pdf; ComponentLink29URL: https://datasheet.ciiva.com/2474/crcwhpe3-2474640.pdf; ComponentLink29Description: https://datasheet.ciiva.com/2474/crcwhpe3-2474640.pdf; ComponentLink30URL: https://datasheet.ciiva.com/48527/crcwhpe3-48527638.pdf; ComponentLink30Description: https://datasheet.ciiva.com/48527/crcwhpe3-48527638.pdf; ComponentLink31URL: https://datasheet.ciiva.com/5547/crcwhpe3-46056-5547896.pdf; ComponentLink31Description: https://datasheet.ciiva.com/5547/crcwhpe3-46056-5547896.pdf; ComponentLink32URL: https://datasheet.ciiva.com/9112/crcwhpe3-9112140.pdf; ComponentLink32Description: https://datasheet.ciiva.com/9112/crcwhpe3-9112140.pdf; ComponentLink33URL: https://datasheet.ciiva.com/2474/crcwhpe3-2474638.pdf; ComponentLink33Description: https://datasheet.ciiva.com/2474/crcwhpe3-2474638.pdf; ComponentLink34URL: https://datasheet.ciiva.com/2474/crcwhpe3-2474639.pdf; ComponentLink34Description: https://datasheet.ciiva.com/2474/crcwhpe3-2474639.pdf; Supplier 1: Digi-Key; Manufacturer Part Number: ERJ-P06J103V; Stock 1: 130484; Pricing 1: 1=0.11, 10=0.103, 100=0.0396, 1000=0.0174, 2500=0.0151 (USD); Mount: Surface Mount; Case/Package: 0805; Weight: 0.000194oz; Case Code (Metric): 2012; Case Code (Imperial): 0805; Contact Plating: Tin; Min Operating Temperature: -55°C; Max Operating Temperature: 155°C; Resistance: 10K; Tolerance: 5%; Packaging: Tape and Reel; Package Quantity: 1; Composition: Thick Film; Number of Terminations: 2; Termination: SMD/SMT; Military Standard: Not; Max Power Dissipation: 500mW; Features: Automotive AEC-Q200; Length: 2mm; Height: 0.6mm; Width: 0.049inch; Depth: 1.25mm; Radiation Hardening: No; REACH SVHC: Unknown; Lead Free: Lead Free; ComponentLink35URL: http://uk.rs-online.com/webdocs/12cb/0900766b812cb812.pdf?src-supplier=RSComponents; ComponentLink35Description: http://uk.rs-online.com/webdocs/12cb/0900766b812cb812.pdf?src-supplier=RSComponents; ComponentLink36URL: http://industrial.panasonic.com/www-data/pdf/AOA0000/AOA0000CE4.pdf?src-supplier=Avnet; ComponentLink36Description: http://industrial.panasonic.com/www-data/pdf/AOA0000/AOA0000CE4.pdf?src-supplier=Avnet; ComponentLink37URL: http://industrial.panasonic.com/www-data/pdf/AOA0000/AOA0000CE4.pdf?src-supplier=Future+Electronics; ComponentLink37Description: http://industrial.panasonic.com/www-data/pdf/AOA0000/AOA0000CE4.pdf?src-supplier=Future+Electronics; ComponentLink38URL: http://www.farnell.com/datasheets/2059624.pdf?src-supplier=Element14; ComponentLink38Description: http://www.farnell.com/datasheets/2059624.pdf?src-supplier=Element14; ComponentLink39URL: https://www.alliedelec.com/m/d/12e4be79354a6c30aae91f11e8182ea0.pdf?src-supplier=Allied+Electronics; ComponentLink39Description: https://www.alliedelec.com/m/d/12e4be79354a6c30aae91f11e8182ea0.pdf?src-supplier=Allied+Electronics; ComponentLink40URL: http://www.farnell.com/datasheets/2059624.pdf?src-supplier=Farnell; ComponentLink40Description: http://www.farnell.com/datasheets/2059624.pdf?src-supplier=Farnell; Supplier Part Number 1: P10KADCT-ND
U6 = NCP186AMX330TAG: IC REG LINEAR 3.3V 1A 8XDFN; Manufacturer: ON Semiconductor; Dropout Voltage: 95mV; Number of Regulators: 1; Min Current Limit: 1.1A; Supplier 1: Digi-Key; Manufacturer Part Number: NCP186AMX330TAG; Stock 1: 5995; Pricing 1: 1=0.48, 10=0.39, 25=0.3564, 100=0.2405, 250=0.199, 500=0.18242, 1000=0.13682 (USD); Mount: Surface Mount; Number of Pins: 8; Min Operating Temperature: -40°C; Max Operating Temperature: 125°C; Packaging: Tape and Reel; Output Voltage: 3.3V; Output Current: 1A; Lead Free: Lead Free; ComponentLink1URL: http://www.farnell.com/datasheets/2236905.pdf?src-supplier=Farnell; ComponentLink1Description: http://www.farnell.com/datasheets/2236905.pdf?src-supplier=Farnell; ComponentLink2URL: http://www.farnell.com/datasheets/2236905.pdf?src-supplier=Newark; ComponentLink2Description: http://www.farnell.com/datasheets/2236905.pdf?src-supplier=Newark; ComponentLink3URL: http://www.onsemi.com/pub/Collateral/NCP186-D.PDF?src-supplier=Digi-Key; ComponentLink3Description: http://www.onsemi.com/pub/Collateral/NCP186-D.PDF?src-supplier=Digi-Key; ComponentLink4URL: https://www.onsemi.com/pub/Collateral/NCP186-D.PDF?src-supplier=Digi-Key; ComponentLink4Description: https://www.onsemi.com/pub/Collateral/NCP186-D.PDF?src-supplier=Digi-Key; Supplier Part Number 1: NCP186AMX330TAGOSCT-ND